# Altium schematic sheet Input.SchDoc
size A; SheetNumber: 2; SheetTotal: 5
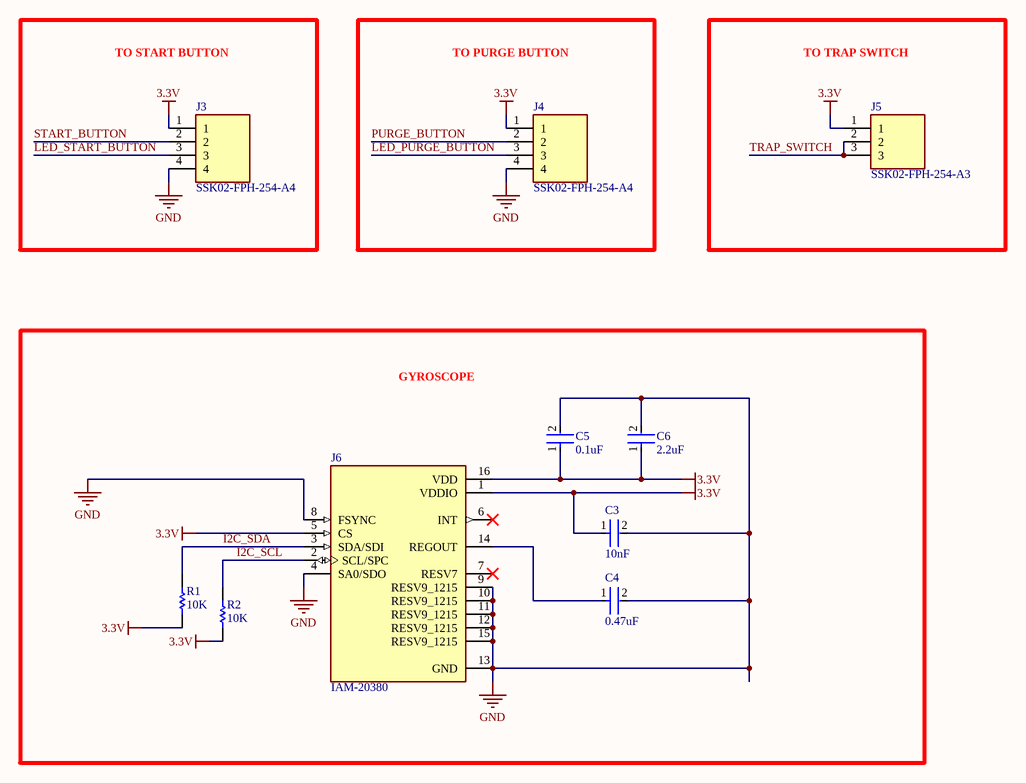
[diagram p0: Input.SchDoc]

## Parts
C3  10nF  [FP-RHE1DB-MFG]
C4  0.47uF  [FP-RHE1DB-MFG]
C5  0.1uF  [FP-RHE1DB-MFG]
C6  2.2uF  [FP-RHE1DB-MFG]
J3  SSK02-FPH-254-A4  [SAMESKY_SSK02-FPH-254-A4]
J4  SSK02-FPH-254-A4  [SAMESKY_SSK02-FPH-254-A4]
J5  SSK02-FPH-254-A3  [SAMESKY_SSK02-FPH-254-A3]
J6  IAM-20380  [PQFN50P300X300X80-16N]
R1  10K  [RESA60-630X240]
R2  10K  [RESA60-630X240]

## Blocks framed on the sheet
TO START BUTTON: J3
TO PURGE BUTTON: J4
TO TRAP SWITCH: J5
GYROSCOPE: C3-C6 J6 R1 R2

## Nets
3.3V: C3.1 C5.1 C6.1 J3.1 J4.1 J5.1 J6.1(VDDIO) J6.5(CS) J6.16(VDD) R1.2 R2.2
GND: C3.2 C4.2 C5.2 C6.2 J3.4 J4.4 J6.4(SA0/SDO) J6.8(FSYNC) J6.9(RESV9_1215) J6.10(RESV9_1215) J6.11(RESV9_1215) J6.12(RESV9_1215) J6.13(GND) J6.15(RESV9_1215)
I2C_SCL: J6.2(SCL/SPC) R2.1
I2C_SDA: J6.3(SDA/SDI) R1.1
LED_PURGE_BUTTON: J4.3
LED_START_BUTTON: J3.3
PURGE_BUTTON: J4.2
START_BUTTON: J3.2
TRAP_SWITCH: J5.2 J5.3
NetC4_1: C4.1 J6.14(REGOUT)

Not connected (* = marked no-connect by the designer): J6 6(INT)* 7(RESV7)*

## Library data of the parts
C3-C6 = CMP-06035-012170-1: Ceramic Capacitor Automotive 330nF ±10% 50V X8L Radial; Tolerance: 10%; Lead Pitch: 2.5mm; Capacitance: 330nF; Max Operating Temperature: 150°C; Dielectric: X8L; Voltage Rating: 50V; Voltage Rating (DC): 50V; Min Operating Temperature: -55°C; REACH SVHC: No SVHC
J3 J4 = SSK02-FPH-254-A4: 4 Position Header Connector 0.100 (2.54mm) Through Hole Gold; MF: Same Sky (Formerly CUI Devices); SnapEDA_Link: https://www.snapeda.com/parts/SSK02-FPH-254-A4/Same+Sky/view-part/?ref=snap; Package: None; Value: *; MP: SSK02-FPH-254-A4; Check_prices: https://www.snapeda.com/parts/SSK02-FPH-254-A4/Same+Sky/view-part/?ref=eda
J5 = SSK02-FPH-254-A3: 2.54MM FEMALE HEADER 1X3PIN, Y T; MF: Same Sky (Formerly CUI Devices); SnapEDA_Link: https://www.snapeda.com/parts/SSK02-FPH-254-A3/Same+Sky/view-part/?ref=snap; Package: None; Value: *; MP: SSK02-FPH-254-A3; Check_prices: https://www.snapeda.com/parts/SSK02-FPH-254-A3/Same+Sky/view-part/?ref=eda
J6 = IAM-20380: Gyroscope X (Pitch), Y (Roll), Z (Yaw) Â±250, 500, 1000, 2000 27kHz I2C, SPI 16-LGA (3x3); MF: TDK InvenSense; SnapEDA_Link: https://www.snapeda.com/parts/IAM-20380/TDK/view-part/?ref=snap; Package: PQFN-16 TDK-InvenSense; Value: *; MP: IAM-20380; Check_prices: https://www.snapeda.com/parts/IAM-20380/TDK/view-part/?ref=eda
R1 R2 = CMP-1659-00070-1: Axial Resistor, 1 MOhm, +/- 1%, 250 mW, -55 to 155 degC, 2-Pin THD, RoHS, Bulk; Power Rating: 250 mW; Resistance: 47.5 kohm; Voltage Rating: 250 V; ComponentLink1Description: Manufacturer URL; PackageReference: MFR-25; ComponentLink2Description: Datasheet; ComponentLink2URL: http://www.yageo.com/documents/recent/Yageo%20LR_MFR_2013.pdf; Tolerance: 1%; DatasheetVersion: Apr-13; Package Quantity: 200; Packaging: Bulk; Case\Package: Axial; RoHSCompliant: true; ComponentLink1URL: http://www.yageo.com/; Length: 0.248 inch; Min Operating Temperature: -55 degC; Mount: Through Hole; PackageDescription: 2-Pin Axial Lead, Dia 2.4 mm, Body Length 6.3 mm; Max Operating Temperature: 155 degC